# Altium schematic sheet Nodo_Ambiente.SchDoc
size A; SheetNumber: 3; SheetTotal: 3
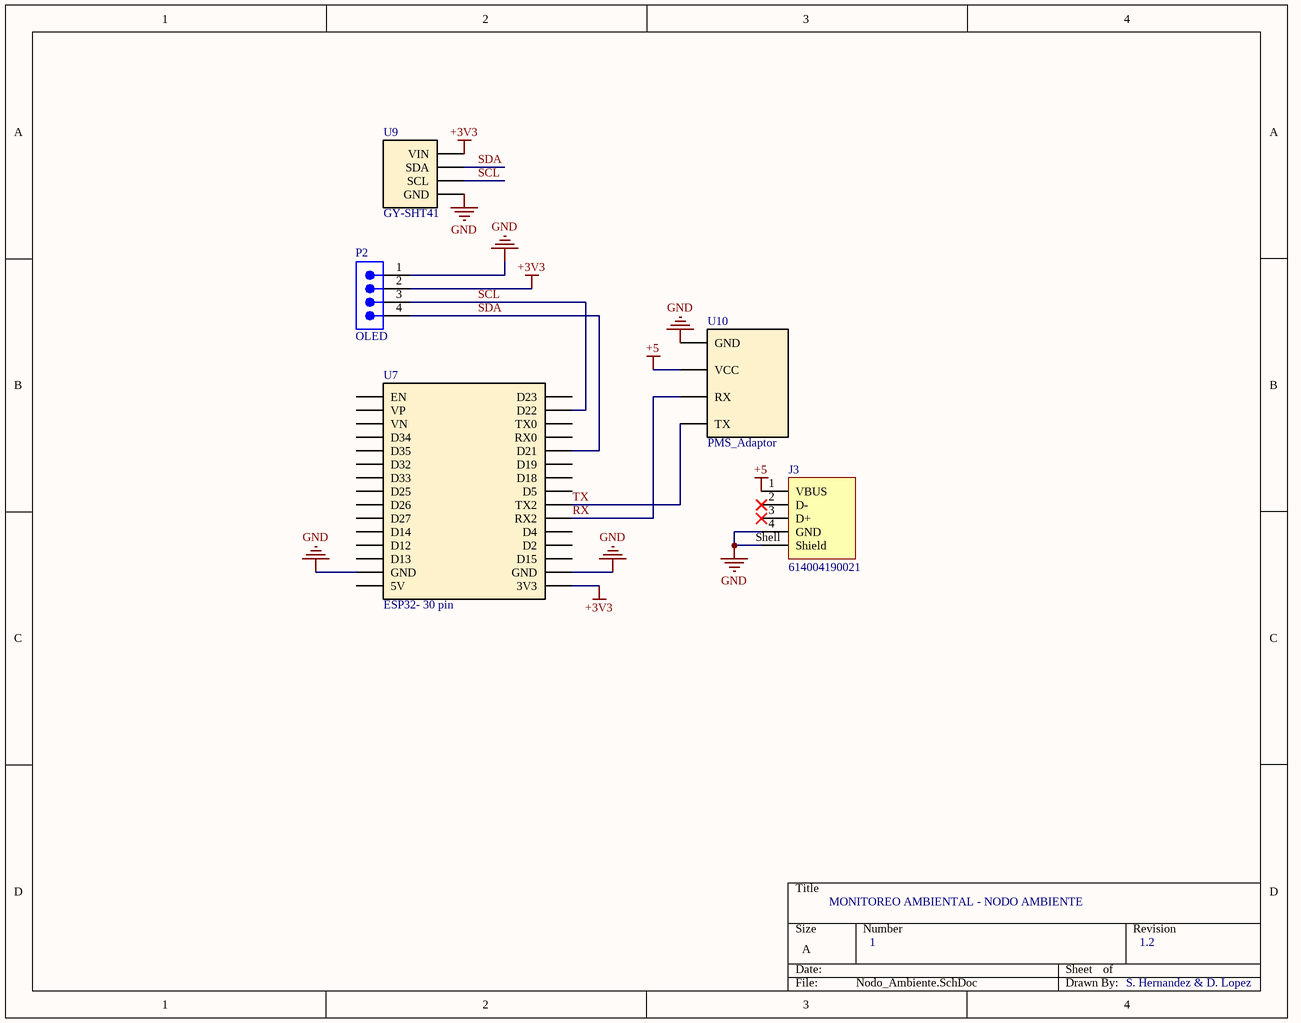
[diagram p0: Nodo_Ambiente.SchDoc]

## Parts
J3  614004190021  [614004190021]
P2  OLED  [SMTC-TSW-104-08-X-S]
U7  ESP32- 30 pin  [ESP32 - 30 pin]
U9  GY-SHT41  [SHT41]
U10  PMS_Adaptor  [PMS_Adaptor]

## Nets
+3V3: P2.2 U7.16(3V3) U9.1(VIN)
+5: J3.1(VBUS) U10.3(VCC)
GND: J3.4(GND) J3.Shell(Shield) P2.1 U7.2(GND) U7.17(GND) U9.2(GND) U10.4(GND)
RX: U7.21(RX2) U10.2(RX)
SCL: P2.3 U7.29(D22) U9.3(SCL)
SDA: P2.4 U7.26(D21) U9.4(SDA)
TX: U7.22(TX2) U10.1(TX)

Not connected (* = marked no-connect by the designer): J3 2(D-)* 3(D+)*; U7 1(5V) 3(D13) 4(D12) 5(D14) 6(D27) 7(D26) 8(D25) 9(D33) 10(D32) 11(D35) 12(D34) 13(VN) 14(VP) 15(EN) 18(D15) 19(D2) 20(D4) 23(D5) 24(D18) 25(D19) 27(RX0) 28(TX0) 30(D23)

## Notes on the sheet
- MONITOREO AMBIENTAL - NODO AMBIENTE
- 1
- 1.2
- S. Hernandez & D. Lopez

## Library data of the parts
J3 = CMP-1502-03228-3: USB Connector, 2.0 TYPE A, RECEPTACLE, THT; Connector Type: USB Type A; Standard: USB 2.0; Gender: Receptacle; No. of...; USB Standard: USB 2.0; Insulation Resistance: 1GΩ; Current Rating: 3A; Number of Contacts: 4; Operating Supply Voltage: 30V; Contact Resistance: 30mΩ; Housing Color: White; Contact Material: Brass; Orientation: Horizontal; Connector Type: USB; Max Operating Temperature: 85°C; Contact Plating: Gold; Number of Pins: 4; REACH SVHC: No; Insulation Material: PBT; Min Operating Temperature: -40°C; Mount: Horizontal, Through Hole; RoHS: Compliant
P2 = CMP-1024-00358-1: 0.025" SQ Post Header, Through-hole, Vertical, -55 to 125 degC, 2.54 mm Pitch, 4-Pin, Male, RoHS; PartNumber: TSW-104-08-L-S; Manufacturer: Samtec; Pitch: 2.54 mm; RoHS: True; Temperature Range: -55 to 125 degC; PackageDescription: .025[0.64] SQ. Post Terminal Strip Assembly; Orientation: Vertical; ComponentLink2URL: http://www.samtec.com/documents/webfiles/pdf/TSW_TH.PDF; ComponentLink1Description: Manufacturer URL; ComponentLink2Description: Datasheet; PackageVersion: DM, 8/1988; ComponentLink3URL: http://www.samtec.com/documents/webfiles/cpdf/TSW-XXX-XX-XXX-X-XX-XXX-MKT.pdf; Mounting Technology: Through-hole; PackageReference: TSW-104-08-X-S; ComponentLink3Description: Package Specification; ComponentLink1URL: http://www.samtec.com; DatasheetVersion: F-214